# Altium schematic sheet Zasilanie.SchDoc (part 1 of 3)
size A2
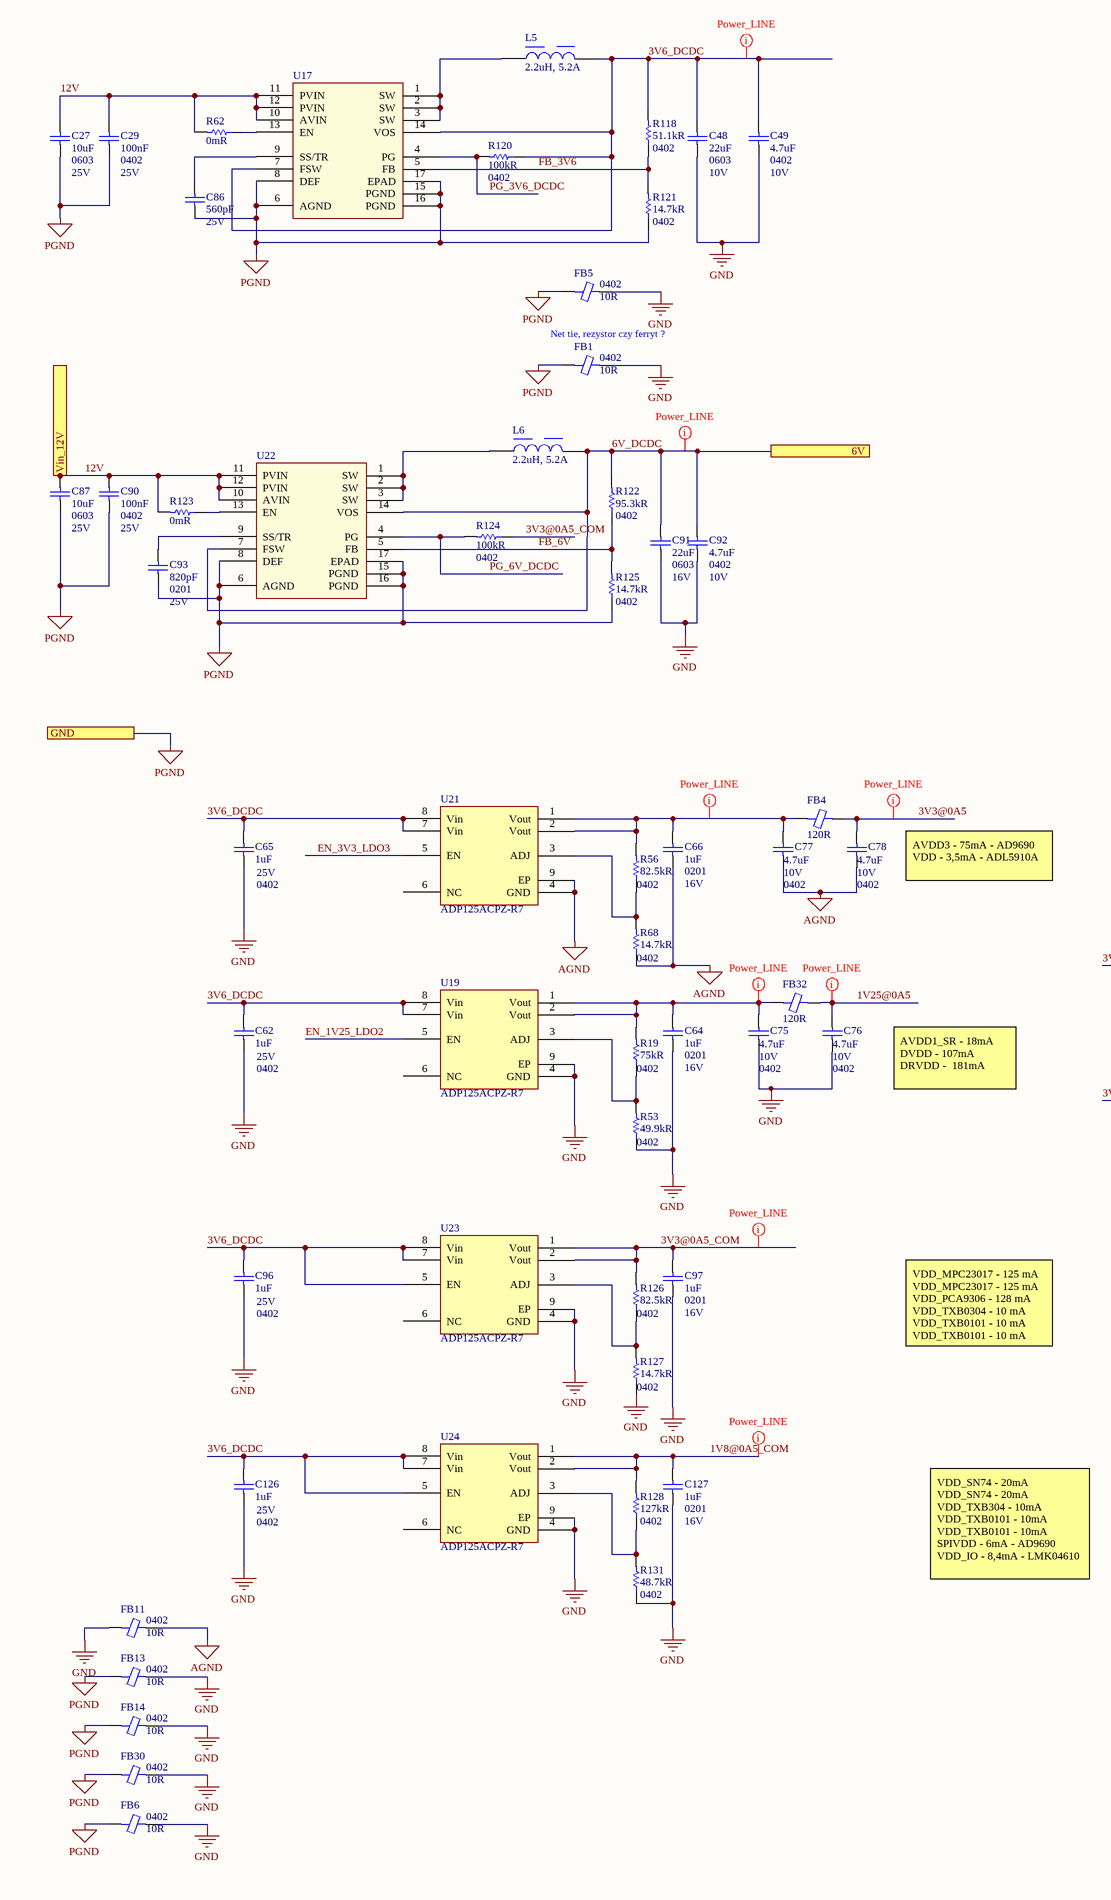
[diagram p0: Zasilanie.SchDoc, left]
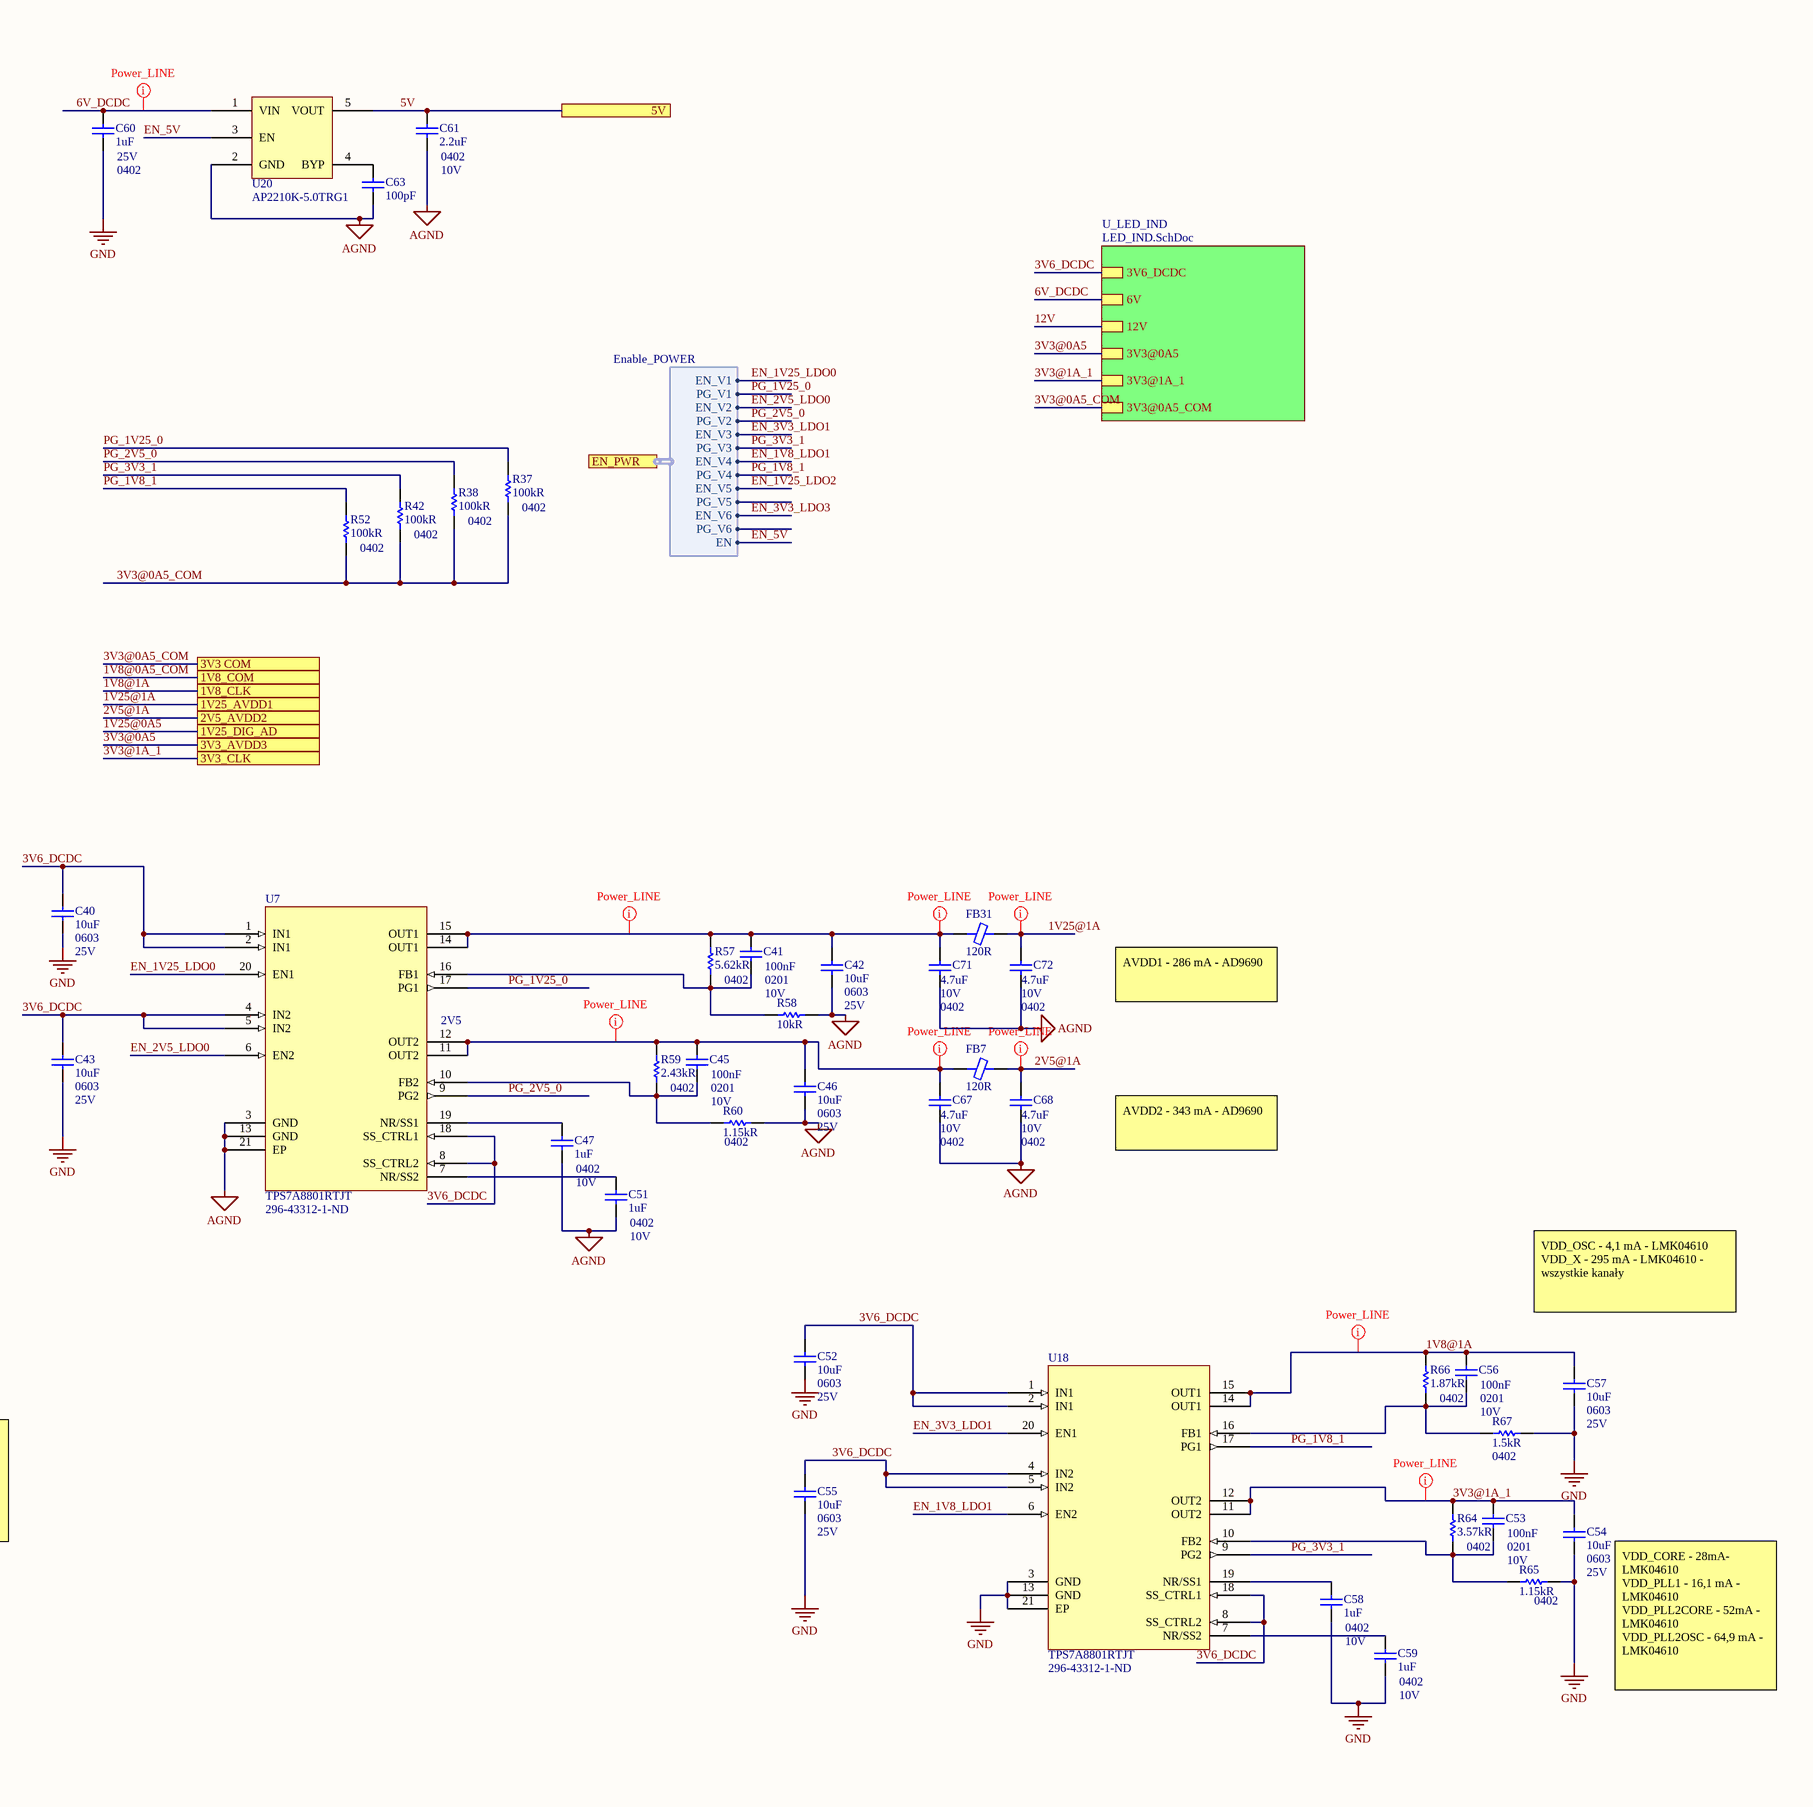
[diagram p1: Zasilanie.SchDoc, right]

## Parts
C27  10uF  Case/Package: 0603  Voltage Rating: 25V  [CAP 0603/1608 RF]
C29  100nF  Case Code (Imperial): 0402  Voltage Rating (DC): 25V  [CAP 0402/1005 RF KK]
C40  10uF  Case/Package: 0603  Voltage Rating: 25V  [CAP 0603/1608 RF]
C41  100nF  Case Code (Imperial): 0201  Voltage Rating (DC): 10V  [CAP 0201/0603 KK]
C42  10uF  Case/Package: 0603  Voltage Rating: 25V  [CAP 0603/1608 RF]
C43  10uF  Case/Package: 0603  Voltage Rating: 25V  [CAP 0603/1608 RF]
C45  100nF  Case Code (Imperial): 0201  Voltage Rating (DC): 10V  [CAP 0201/0603 KK]
C46  10uF  Case/Package: 0603  Voltage Rating: 25V  [CAP 0603/1608 RF]
C47  1uF  Case Code (Imperial): 0402  Voltage Rating (DC): 10V  [CAP 0402/1005 RF KK]
C48  22uF  Case/Package: 0603  Voltage Rating: 10V  [CAP 0603/1608 RF]
C49  4.7uF  Case/Package: 0402  Voltage Rating: 10V  [CAP 0402/1005 RF KK]
C51  1uF  Case Code (Imperial): 0402  Voltage Rating (DC): 10V  [CAP 0402/1005 RF KK]
C52  10uF  Case/Package: 0603  Voltage Rating: 25V  [CAP 0603/1608 RF]
C53  100nF  Case Code (Imperial): 0201  Voltage Rating (DC): 10V  [CAP 0201/0603 KK]
C54  10uF  Case/Package: 0603  Voltage Rating: 25V  [CAP 0603/1608 RF]
C55  10uF  Case/Package: 0603  Voltage Rating: 25V  [CAP 0603/1608 RF]
C56  100nF  Case Code (Imperial): 0201  Voltage Rating (DC): 10V  [CAP 0201/0603 KK]
C57  10uF  Case/Package: 0603  Voltage Rating: 25V  [CAP 0603/1608 RF]
C58  1uF  Case Code (Imperial): 0402  Voltage Rating (DC): 10V  [CAP 0402/1005 RF KK]
C59  1uF  Case Code (Imperial): 0402  Voltage Rating (DC): 10V  [CAP 0402/1005 RF KK]
C60  1uF  Case/Package: 0402  Voltage Rating: 25V  [CAP 0402/1005 RF KK]
C61  2.2uF  Case Code (Imperial): 0402  Voltage Rating (DC): 10V  [CAP 0402/1005 RF KK]
C62  1uF  Case/Package: 0402  Voltage Rating: 25V  [CAP 0402/1005 RF KK]
C63  100pF  [CAP 0402/1005 RF KK]
C64  1uF  Case/Package: 0201  Voltage Rating: 16V  [CAP 0201/0603 KK]
C65  1uF  Case/Package: 0402  Voltage Rating: 25V  [CAP 0402/1005 RF KK]
C66  1uF  Case/Package: 0201  Voltage Rating: 16V  [CAP 0201/0603 KK]
C67  4.7uF  Case/Package: 0402  Voltage Rating: 10V  [CAP 0402/1005 RF KK]
C68  4.7uF  Case/Package: 0402  Voltage Rating: 10V  [CAP 0402/1005 RF KK]
C71  4.7uF  Case/Package: 0402  Voltage Rating: 10V  [CAP 0402/1005 RF KK]
C72  4.7uF  Case/Package: 0402  Voltage Rating: 10V  [CAP 0402/1005 RF KK]
C75  4.7uF  Case/Package: 0402  Voltage Rating: 10V  [CAP 0402/1005 RF KK]
C76  4.7uF  Case/Package: 0402  Voltage Rating: 10V  [CAP 0402/1005 RF KK]
C77  4.7uF  Case/Package: 0402  Voltage Rating: 10V  [CAP 0402/1005 RF KK]
C78  4.7uF  Case/Package: 0402  Voltage Rating: 10V  [CAP 0402/1005 RF KK]
C86  560pF  Voltage Rating (DC): 25V  [CAP 0201/0603 KK]
C87  10uF  Case/Package: 0603  Voltage Rating: 25V  [CAP 0603/1608 RF]
C90  100nF  Case Code (Imperial): 0402  Voltage Rating (DC): 25V  [CAP 0402/1005 RF KK]
C91  22uF  Case/Package: 0603  Voltage Rating: 16V  [CAP 0603/1608 RF]
C92  4.7uF  Case/Package: 0402  Voltage Rating: 10V  [CAP 0402/1005 RF KK]
C93  820pF  Case/Package: 0201  Voltage Rating: 25V  [CAP 0201/0603 KK]
C96  1uF  Case/Package: 0402  Voltage Rating: 25V  [CAP 0402/1005 RF KK]
C97  1uF  Case/Package: 0201  Voltage Rating: 16V  [CAP 0201/0603 KK]
C126  1uF  Case/Package: 0402  Voltage Rating: 25V  [CAP 0402/1005 RF KK]
C127  1uF  Case/Package: 0201  Voltage Rating: 16V  [CAP 0201/0603 KK]
FB1  10R  Case/Package: 0402  [FER 0402/1005 KK]
FB4  120R  [FER 0603/1608 KK]
FB5  10R  Case/Package: 0402  [FER 0402/1005 KK]
FB6  10R  Case/Package: 0402  [FER 0402/1005 KK]
FB7  120R  [FER 0603/1608 KK]
FB11  10R  Case/Package: 0402  [FER 0402/1005 KK]
FB13  10R  Case/Package: 0402  [FER 0402/1005 KK]
FB14  10R  Case/Package: 0402  [FER 0402/1005 KK]
FB30  10R  Case/Package: 0402  [FER 0402/1005 KK]
FB31  120R  [FER 0603/1608 KK]
FB32  120R  [FER 0603/1608 KK]
L5  2.2uH, 5.2A  [WE-MAPI_4030]
L6  2.2uH, 5.2A  [WE-MAPI_4030]
R19  75kR  Case/Package: 0402  [RES 0402/1005 RF KK]
R37  100kR  Case/Package: 0402  [RES 0402/1005 RF KK]
R38  100kR  Case/Package: 0402  [RES 0402/1005 RF KK]
R42  100kR  Case/Package: 0402  [RES 0402/1005 RF KK]
R52  100kR  Case/Package: 0402  [RES 0402/1005 RF KK]
R53  49.9kR  Case/Package: 0402  [RES 0402/1005 RF KK]
R56  82.5kR  Case/Package: 0402  [RES 0402/1005 RF KK]
R57  5.62kR  Case/Package: 0402  [RES 0402/1005 RF KK]
R58  10kR  [RES 0402/1005 RF KK]
R59  2.43kR  Case/Package: 0402  [RES 0402/1005 RF KK]
R60  1.15kR  Case/Package: 0402  [RES 0402/1005 RF KK]
R62  0mR  [RES 0402/1005 RF KK]
R64  3.57kR  Case/Package: 0402  [RES 0402/1005 RF KK]
R65  1.15kR  Case/Package: 0402  [RES 0402/1005 RF KK]
R66  1.87kR  Case/Package: 0402  [RES 0402/1005 RF KK]
R67  1.5kR  Case/Package: 0402  [RES 0402/1005 RF KK]
R68  14.7kR  Case/Package: 0402  [RES 0402/1005 RF KK]
R118  51.1kR  Case/Package: 0402  [RES 0402/1005 RF KK]
R120  100kR  Case/Package: 0402  [RES 0402/1005 RF KK]
R121  14.7kR  Case/Package: 0402  [RES 0402/1005 RF KK]
R122  95.3kR  Case/Package: 0402  [RES 0402/1005 RF KK]
R123  0mR  [RES 0402/1005 RF KK]
R124  100kR  Case/Package: 0402  [RES 0402/1005 RF KK]
R125  14.7kR  Case/Package: 0402  [RES 0402/1005 RF KK]
R126  82.5kR  Case/Package: 0402  [RES 0402/1005 RF KK]
R127  14.7kR  Case/Package: 0402  [RES 0402/1005 RF KK]
R128  127kR  Case/Package: 0402  [RES 0402/1005 RF KK]
R131  48.7kR  Case/Package: 0402  [RES 0402/1005 RF KK]
U7  TPS7A8801RTJT  Supplier Part Number 1: 296-43312-1-ND  [TPS7A88]
U17  TPS62130RGTR  [VQFN50P300x300-16-EPAD]  (value not drawn)
U18  TPS7A8801RTJT  Supplier Part Number 1: 296-43312-1-ND  [TPS7A88]
U19  ADP125ACPZ-R7  [ADP124_125_KK]
U20  AP2210K-5.0TRG1  [AP2210K-3.3TRG1]
U21  ADP125ACPZ-R7  [ADP124_125_KK]
U22  TPS62130RGTR  [VQFN50P300x300-16-EPAD]  (value not drawn)
U23  ADP125ACPZ-R7  [ADP124_125_KK]
U24  ADP125ACPZ-R7  [ADP124_125_KK]

## Sub-sheets
U_LED_IND = LED_IND.SchDoc: 6V, 12V, 3V3@0A5, 3V3@1A_1, 3V3@0A5_COM, 3V6_DCDC

## Ports
1V8_CLK, 1V8_COM, 1V25_AVDD1, 1V25_DIG_AD, 2V5_AVDD2, 3V3 COM, 3V3_AVDD3, 3V3_CLK, 5V, 6V, EN_PWR (harness Enable_POWER), GND, Vin_12V

## Harnesses
Enable_POWER: EN_V1, PG_V1, EN_V2, PG_V2, EN_V3, PG_V3, EN_V4, PG_V4, EN_V5, PG_V5, EN_V6, PG_V6, EN

## Nets
AGND: C42.1 C46.1 C47.2 C51.2 C61.1 C63.1 C66.1 C67.1 C68.1 C71.1 C72.1 C77.1 C78.1 FB11.2 R58.1 R60.1 R68.1 U7.3(GND) U7.13(GND) U7.21(EP) U20.2(GND) U21.4(GND) U21.9(EP)
GND: C40.1 C43.1 C48.1 C49.1 C52.1 C54.1 C55.1 C57.1 C58.2 C59.2 C60.1 C62.1 C64.1 C65.1 C75.1 C76.1 C91.1 C92.1 C96.1 C97.1 C126.1 C127.1 FB1.2 FB5.2 FB6.2 FB11.1 FB13.2 FB14.2 FB30.2 R53.1 R65.1 R67.1 R127.1 R131.1 U18.3(GND) U18.13(GND) U18.21(EP) U19.4(GND) U19.9(EP) U23.4(GND) U23.9(EP) U24.4(GND) U24.9(EP)
PGND: C27.1 C29.1 C86.1 C87.1 C90.1 C93.1 FB1.1 FB5.1 FB6.1 FB13.1 FB14.1 FB30.1 R121.1 R125.1 U17.6(AGND) U17.8(DEF) U17.15(PGND) U17.16(PGND) U17.17(EPAD) U22.6(AGND) U22.8(DEF) U22.15(PGND) U22.16(PGND) U22.17(EPAD) ; port GND
1V8@0A5_COM: C127.2 R128.2 U24.1(Vout) U24.2(Vout) ; port 1V8_COM
1V8@1A: C56.2 C57.2 R66.2 U18.14(OUT1) U18.15(OUT1) ; port 1V8_CLK
1V25@0A5: C76.2 FB32.2 ; port 1V25_DIG_AD
1V25@1A: C72.2 FB31.2 ; port 1V25_AVDD1
2V5@1A: C68.2 FB7.2 ; port 2V5_AVDD2
3V3@0A5: C78.2 FB4.2 ; port 3V3_AVDD3, sheet U_LED_IND/3V3@0A5
3V3@0A5_COM: C97.2 R37.1 R38.1 R42.1 R52.1 R124.1 R126.2 U23.1(Vout) U23.2(Vout) ; port 3V3 COM, sheet U_LED_IND/3V3@0A5_COM
3V3@1A_1: C53.2 C54.2 R64.2 U18.11(OUT2) U18.12(OUT2) ; port 3V3_CLK, sheet U_LED_IND/3V3@1A_1
3V6_DCDC: C40.2 C43.2 C48.2 C49.2 C52.2 C55.2 C62.2 C65.2 C96.2 C126.2 L5.2 R118.2 R120.1 U7.1(IN1) U7.2(IN1) U7.4(IN2) U7.5(IN2) U7.8(SS_CTRL2) U7.18(SS_CTRL1) U17.7(FSW) U17.14(VOS) U18.1(IN1) U18.2(IN1) U18.4(IN2) U18.5(IN2) U18.8(SS_CTRL2) U18.18(SS_CTRL1) U19.7(Vin) U19.8(Vin) U21.7(Vin) U21.8(Vin) U23.5(EN) U23.7(Vin) U23.8(Vin) U24.5(EN) U24.7(Vin) U24.8(Vin) ; sheet U_LED_IND/3V6_DCDC
5V: C61.2 U20.5(VOUT) ; port 5V
6V_DCDC: C60.2 C91.2 C92.2 L6.2 R122.2 U20.1(VIN) U22.7(FSW) U22.14(VOS) ; port 6V, sheet U_LED_IND/6V
12V: C27.2 C29.2 C87.2 C90.2 R62.2 R123.2 U17.10(AVIN) U17.11(PVIN) U17.12(PVIN) U22.10(AVIN) U22.11(PVIN) U22.12(PVIN) ; port Vin_12V, sheet U_LED_IND/12V
EN_1V8_LDO1: U18.6(EN2) ; port EN_PWR.EN_V4
EN_1V25_LDO0: U7.20(EN1) ; port EN_PWR.EN_V1
EN_1V25_LDO2: U19.5(EN) ; port EN_PWR.EN_V5
EN_2V5_LDO0: U7.6(EN2) ; port EN_PWR.EN_V2
EN_3V3_LDO1: U18.20(EN1) ; port EN_PWR.EN_V3
EN_3V3_LDO3: U21.5(EN) ; port EN_PWR.EN_V6
EN_5V: U20.3(EN) ; port EN_PWR.EN
FB_3V6: R118.1 R121.2 U17.5(FB)
FB_6V: R122.1 R125.2 U22.5(FB)
PG_1V8_1: R52.2 U18.17(PG1) ; port EN_PWR.PG_V4
PG_1V25_0: R37.2 U7.17(PG1) ; port EN_PWR.PG_V1
PG_2V5_0: R38.2 U7.9(PG2) ; port EN_PWR.PG_V2
PG_3V3_1: R42.2 U18.9(PG2) ; port EN_PWR.PG_V3
PG_3V6_DCDC: R120.2 U17.4(PG)
PG_6V_DCDC: R124.2 U22.4(PG)
NetC41_1: C41.1 R57.1 R58.2 U7.16(FB1)
NetC41_2: C41.2 C42.2 C71.2 FB31.1 R57.2 U7.14(OUT1) U7.15(OUT1)
NetC45_1: C45.1 R59.1 R60.2 U7.10(FB2)
NetC45_2: C45.2 C46.2 C67.2 FB7.1 R59.2 U7.11(OUT2) U7.12(OUT2)
NetC47_1: C47.1 U7.19(NR/SS1)
NetC51_1: C51.1 U7.7(NR/SS2)
NetC53_1: C53.1 R64.1 R65.2 U18.10(FB2)
NetC56_1: C56.1 R66.1 R67.2 U18.16(FB1)
NetC58_1: C58.1 U18.19(NR/SS1)
NetC59_1: C59.1 U18.7(NR/SS2)
NetC63_2: C63.2 U20.4(BYP)
NetC64_2: C64.2 C75.2 FB32.1 R19.2 U19.1(Vout) U19.2(Vout)
NetC66_2: C66.2 C77.2 FB4.1 R56.2 U21.1(Vout) U21.2(Vout)
NetC86_2: C86.2 U17.9(SS/TR)
NetC93_2: C93.2 U22.9(SS/TR)
NetL5_1: L5.1 U17.1(SW) U17.2(SW) U17.3(SW)
NetL6_1: L6.1 U22.1(SW) U22.2(SW) U22.3(SW)
NetR19_1: R19.1 R53.2 U19.3(ADJ)
NetR56_1: R56.1 R68.2 U21.3(ADJ)
NetR62_1: R62.1 U17.13(EN)
NetR123_1: R123.1 U22.13(EN)
NetR126_1: R126.1 R127.2 U23.3(ADJ)
NetR128_1: R128.1 R131.2 U24.3(ADJ)

Not connected (* = marked no-connect by the designer): U19 6(NC); U21 6(NC); U23 6(NC); U24 6(NC)

## Layout directives
net class Power_LINE: 1V8@0A5_COM, 1V8@1A, 1V25@0A5, 1V25@1A, 2V5@1A, 3V3@0A5, 3V3@0A5_COM, 3V3@1A_1, 3V6_DCDC, 6V_DCDC, NetC41_2, NetC45_2, NetC64_2, NetC66_2

## Notes on the sheet
- Net tie, rezystor czy ferryt ?
- AVDD3 - 75mA - AD9690
  VDD - 3,5mA - ADL5910A
- AVDD1_SR - 18mA
  DVDD - 107mA
  DRVDD -  181mA
- (near U7) 2V5
- AVDD1 - 286 mA - AD9690
- AVDD2 - 343 mA - AD9690
- VDD_MPC23017 - 125 mA
  VDD_MPC23017 - 125 mA
  VDD_PCA9306 - 128 mA
  VDD_TXB0304 - 10 mA
  VDD_TXB0101 - 10 mA
  VDD_TXB0101 - 10 mA
- VDD_OSC - 4,1 mA - LMK04610
  VDD_X - 295 mA - LMK04610 - wszystkie kanały
- VDD_SN74 - 20mA
  VDD_SN74 - 20mA
  VDD_TXB304 - 10mA
  VDD_TXB0101 - 10mA
  VDD_TXB0101 - 10mA
  SPIVDD - 6mA - AD9690
  VDD_IO - 8,4mA - LMK04610
- (near C54) VDD_CORE - 28mA- LMK04610
  VDD_PLL1 - 16,1 mA - LMK04610
  VDD_PLL2CORE - 52mA - LMK04610
  VDD_PLL2OSC - 64,9 mA - LMK04610
- Title
- Size:
- Date:
- File:
- A2
- Number:
- Time:
- Revision:
- Sheet
- of